# EAGLE schematic pcb (EAGLE 9.6.2)
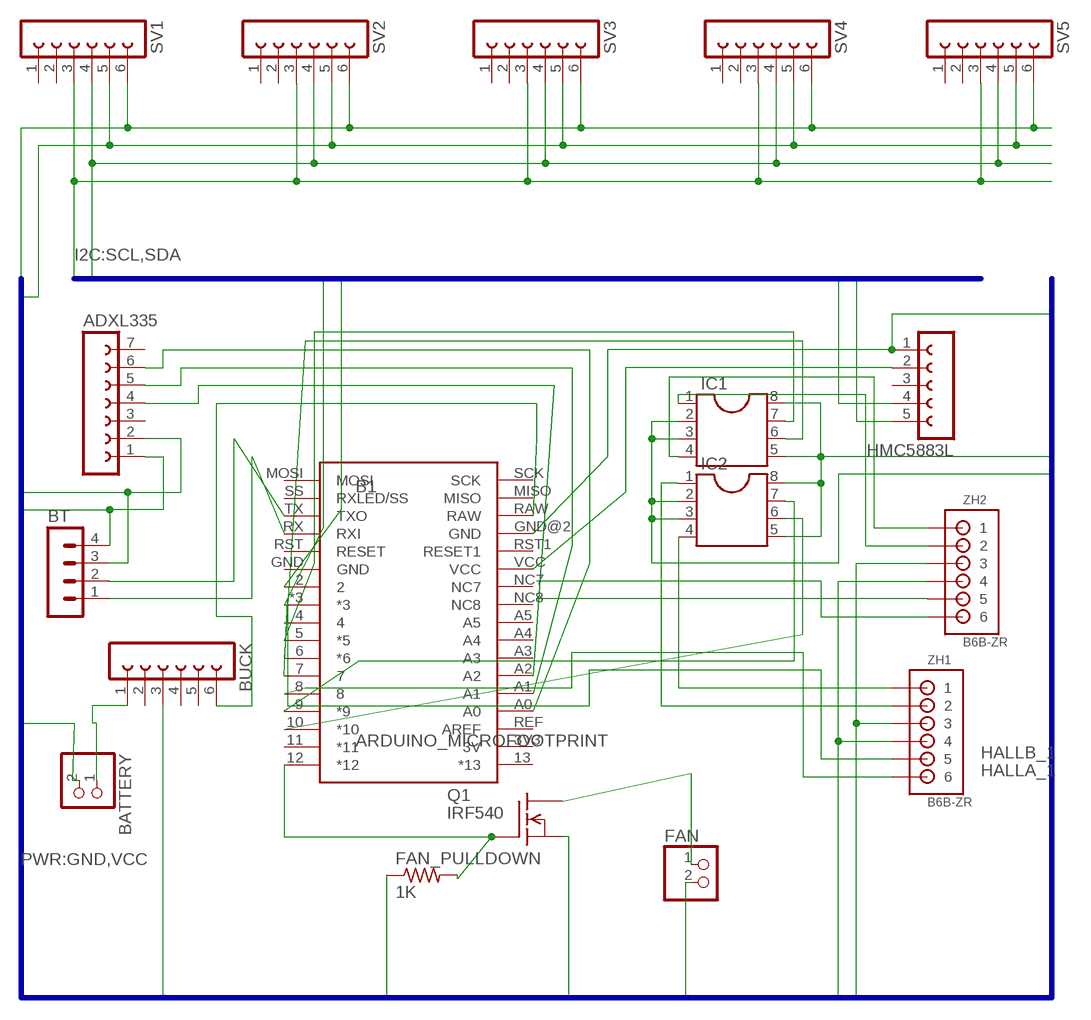
[diagram p0: schematic, sheet 1]

## Parts
ADXL335  FE07-1  [FE07]
B1  ARDUINO_MICROFOOTPRINT  [ARDUINO-MICRO]
BATTERY  PINHD-1X2  [1X02]
BT  MA04-1  [MA04-1]
BUCK  FE06-1  [FE06]
FAN  PINHD-1X2  [1X02]
FAN_PULLDOWN  1K  R-US_0207/10  [0207/10]
HMC5883L  FE05-1  [FE05-1]
IC1  DIL8S  [SOCKET-08]
IC2  DIL8S  [SOCKET-08]
Q1  IRF540  [TO220]
SV1  FE06-1  [FE06]
SV2  FE06-1  [FE06]
SV3  FE06-1  [FE06]
SV4  FE06-1  [FE06]
SV5  FE06-1  [FE06]
ZH1  B6B-ZR  [B6B-ZR]
ZH2  B6B-ZR  [B6B-ZR]

## Nets
GND: ADXL335.2 B1.GND@2(GND) BATTERY.2 BT.3 BUCK.3 FAN_PULLDOWN.1 HMC5883L.1 IC1.5 IC1.8 IC2.5 IC2.8 Q1.3(S) SV1.5 SV2.5 SV3.5 SV4.5 SV5.5 ZH1.4 ZH2.4
HALLA_1: B1.8 ZH1.6
HALLB_1: B1.7 ZH1.5
N$1: B1.9(*9) IC2.7
N$2: B1.TX(TXO) BT.2
N$3: B1.10(*10) IC2.6
N$4: ADXL335.4 B1.A2
N$5: ADXL335.5 B1.A1
N$6: ADXL335.6 B1.A0
N$7: BATTERY.1 BUCK.1
N$8: B1.RAW BUCK.6
N$9: B1.5(*5) IC1.7
N$10: B1.6(*6) IC1.6
N$11: ZH2.5
N$12: ZH2.6
N$13: IC1.1 ZH2.2
N$14: IC1.4 ZH2.1
N$15: IC2.4 ZH1.1
N$16: IC2.1 ZH1.2
N$17: B1.VCC HMC5883L.2
N$18: FAN.1 Q1.2(D)
N$19: B1.12(*12) FAN_PULLDOWN.2 Q1.1(G)
RX: B1.RX(RXI) BT.1
SCL: B1.*3 HMC5883L.4 SV1.4 SV2.4 SV3.4 SV4.4 SV5.4
SDA: B1.2 HMC5883L.5 SV1.3 SV2.3 SV3.3 SV4.3 SV5.3
VCC: ADXL335.1 BT.4 FAN.2 IC1.2 IC1.3 IC2.2 IC2.3 SV1.6 SV2.6 SV3.6 SV4.6 SV5.6 ZH1.3 ZH2.3
Unconnected: ADXL335.3 ADXL335.7 B1.3V3(3V) B1.4 B1.11(*11) B1.13(*13) B1.A3 B1.A4 B1.A5 B1.GND B1.MISO B1.MOSI B1.NC7 B1.NC8 B1.REF(AREF) B1.RST1(RESET1) B1.RST(RESET) B1.SCK B1.SS(RXLED/SS) BUCK.2 BUCK.4 BUCK.5 HMC5883L.3 SV1.1 SV1.2 SV2.1 SV2.2 SV3.1 SV3.2 SV4.1 SV4.2 SV5.1 SV5.2

## Buses
I2C:SCL,SDA
PWR:GND,VCC

## Library data of the parts
ADXL335 = con-lsta:FE07-1: FEMALE HEADER; OC_FARNELL: unknown; OC_NEWARK: unknown
B1 = Arduino Micro1:ARDUINO_MICRO
BATTERY FAN = pinhead:PINHD-1X2: PIN HEADER
BT = con-lstb:MA04-1: PIN HEADER; OC_FARNELL: unknown; OC_NEWARK: unknown
BUCK SV1-SV5 = con-lsta:FE06-1: FEMALE HEADER; OC_FARNELL: unknown; OC_NEWARK: unknown
FAN_PULLDOWN = rcl:R-US_: RESISTOR, American symbol; SPICEPREFIX: R
HMC5883L = con-lsta:FE05-1: FEMALE HEADER; OC_FARNELL: unknown; OC_NEWARK: unknown
IC1 IC2 = ic-package:DIL8: Dual In Line / Socket
Q1 = transistor-fet:IRF540: N-Channel Enhancement MOSFET (HEXFET); 100V; 28A; 0,077Ohm
ZH1 ZH2 = JST ZH:B6B-ZR: JST-ZH Connector 6 pol, 1.5mm pitch Package: B6B-ZR Source: http://www.jst-mfg.com/product/pdf/eng/eZH.pdf